# Altium schematic sheet Power.SchDoc
size A4; DocumentNumber: 2; SheetNumber: 3; SheetTotal: 8
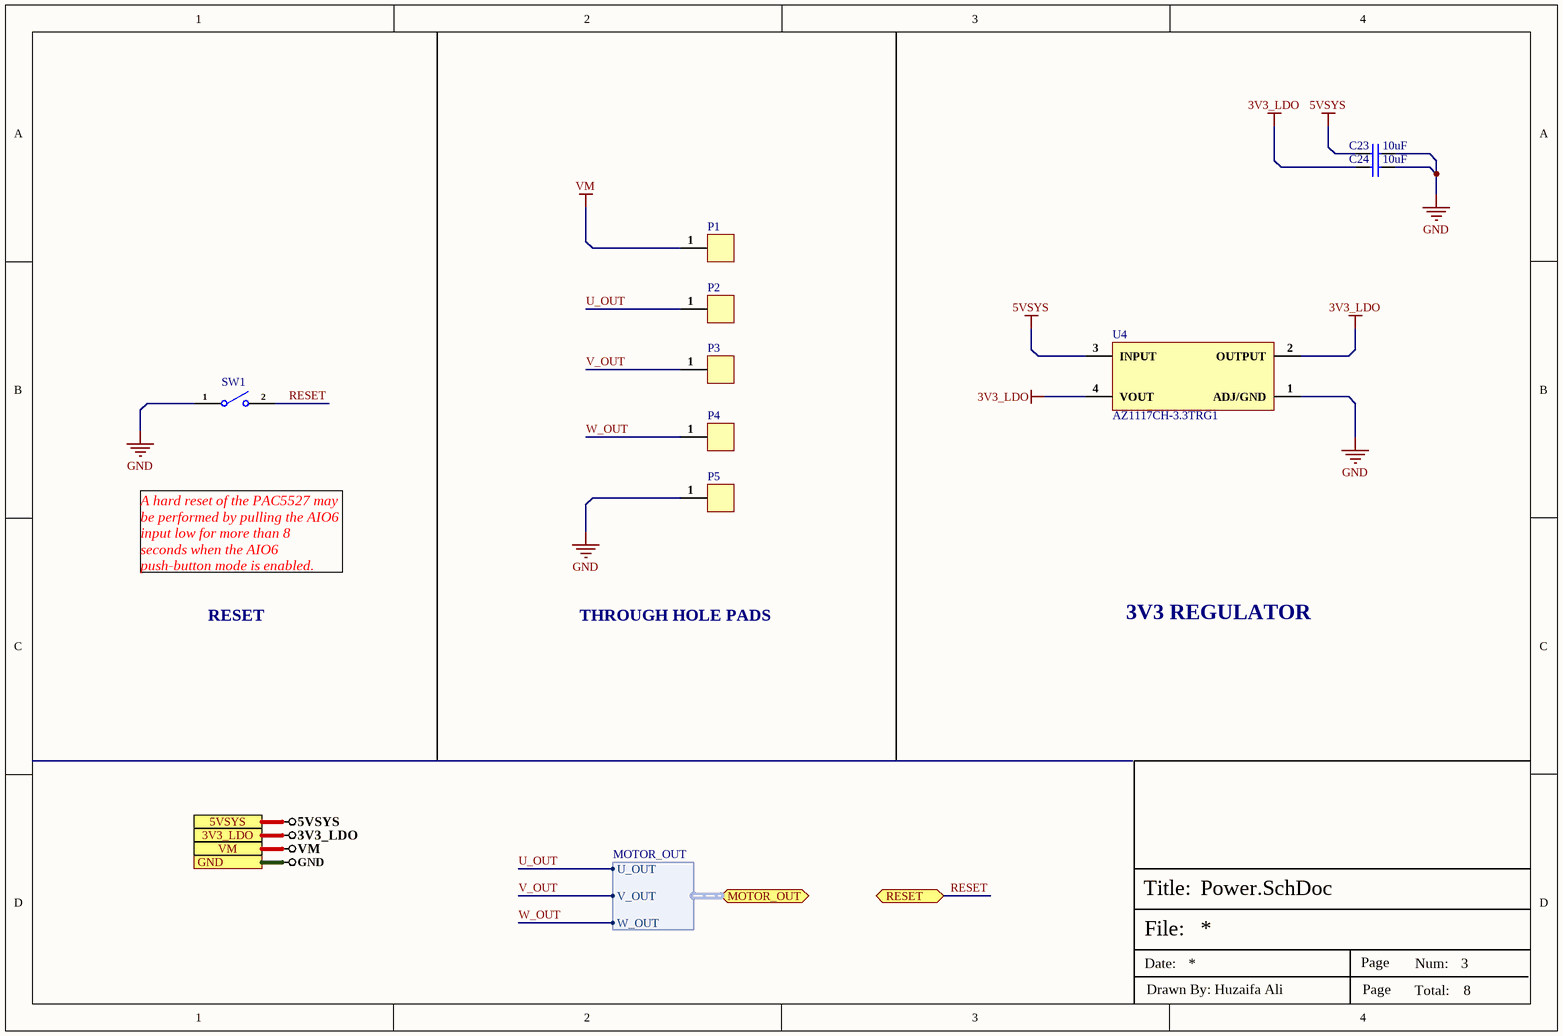
[diagram p0: Power.SchDoc]

## Parts
C23  10uF  [Cap-0402]
C24  10uF  [Cap-0402]
P1  Through_Hole_Pad  [Through Hole Pad (High Power)_]  (value not drawn)
P2  Through_Hole_Pad  [Through Hole Pad (High Power)_]  (value not drawn)
P3  Through_Hole_Pad  [Through Hole Pad (High Power)_]  (value not drawn)
P4  Through_Hole_Pad  [Through Hole Pad (High Power)_]  (value not drawn)
P5  Through_Hole_Pad  [Through Hole Pad (High Power)_]  (value not drawn)
SW1  TS-1185EC-C-D-B  [TS-1185EC-C-D-B_]  (value not drawn)
U4  AZ1117CH-3.3TRG1  [SOT- 223]

## Ports
3V3_LDO, 5VSYS, GND, MOTOR_OUT (bidir, harness MOTOR_OUT), RESET (bidir), VM

## Harnesses
MOTOR_OUT: U_OUT, V_OUT, W_OUT

## Nets
3V3_LDO: C24.1 U4.2(OUTPUT) U4.4(VOUT) ; port 3V3_LDO
5VSYS: C23.1 U4.3(INPUT) ; port 5VSYS
GND: C23.2 C24.2 P5.1 SW1.1 U4.1(ADJ/GND) ; port GND
VM: P1.1 ; port VM
RESET: SW1.2 ; port RESET
U_OUT: P2.1 ; port MOTOR_OUT.U_OUT
V_OUT: P3.1 ; port MOTOR_OUT.V_OUT
W_OUT: P4.1 ; port MOTOR_OUT.W_OUT

## Notes on the sheet
- A hard reset of the PAC5527 may be performed by pulling the AIO6 input low for more than 8
  seconds when the AIO6 push-button mode is enabled.
- RESET
- THROUGH HOLE PADS
- 3V3 REGULATOR
- File:
- Title:
- Date:
- Page
- Num:
- Total:
- Drawn By: Huzaifa Ali

## Library data of the parts
C23 C24 = CC0402MRX5R6BB106: CAP CER 10UF 10V X5R 0402; Manufacturer: Yageo; Tolerance: 20%; Item Type: Capacitor; Supplier 1: Future Electronics; Manufacturer Part Number: CC0402MRX5R6BB106; RoHS: Yes; Category: Ceramic Capacitors; Stock 1: 80000; Pricing 1: 10000=0.02650, 20000=0.02590, 30000=0.02550, 40000=0.02530, 50000=0.02450 (USD); Mount: Surface Mount; Case/Package: 0402; Case Code (Imperial): 0402; Case Code (Metric): 1005; Min Operating Temperature: -55°C; Max Operating Temperature: 85°C; Packaging: Tape and Reel; Capacitance: 10uF; Voltage Rating: 10V; RoHS Compliant: Yes; ComponentLink1URL: http://www.yageo.com/documents/recent/UPY-GPHC_X5R_4V-to-50V_25.pdf?src-supplier=Digi-Key; ComponentLink1Description: http://www.yageo.com/documents/recent/UPY-GPHC_X5R_4V-to-50V_25.pdf?src-supplier=Digi-Key; Supplier Part Number 1: 6097631; LCSC Part Number: C962143
P1-P5 = Through_Hole_Pad: Wire Connecting Pad
SW1 = TS-1185EC-C-D-B: 3mm 2mm Round Button 50mA Top3.65mm SPST 12V SMD Tactile Switches; Manufacturer: XKB; Manufacturer Part Number: TS-1185EC-C-D-B; Footprint: Custom; ComponentLink1Description: LCSC; ComponentLink1URL: https://lcsc.com/product-detail/Tactile-Switches_XKB-Connectivity-TS-1185EC-C-D-B_C318893.html; LCSC Part Number: C318893
U4 = AZ1117CH-3.3TRG1: 15V 1.3V @ 800mA Fixed 3.3V SOT-223 Linear Voltage Regulators (LDO) ROHS; Manufacturer: Diodes Incorporated; Item Type: IC; Manufacturer Part Number: AZ1117CH-3.3TRG1; Package: SOT-223; LCSC Part Number: C92102